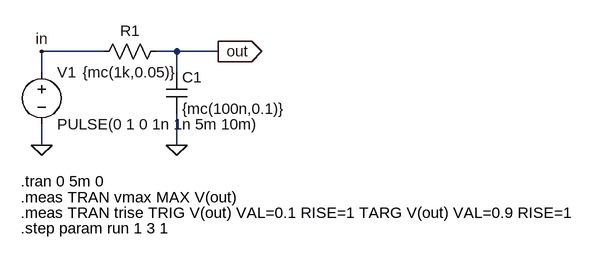
[diagram p0: schematic rc_mc.asc]
rc_mc.asc, the LTspice schematic file:
Version 4
SHEET 1 880 680
WIRE 112 96 16 96
WIRE 224 96 192 96
WIRE 288 96 224 96
WIRE 16 128 16 96
WIRE 224 128 224 96
WIRE 16 240 16 208
WIRE 224 240 224 192
FLAG 16 240 0
FLAG 224 240 0
FLAG 288 96 out
IOPIN 288 96 Out
FLAG 16 96 in
SYMBOL voltage 16 112 R0
SYMATTR InstName V1
SYMATTR Value PULSE(0 1 0 1n 1n 5m 10m)
SYMBOL res 208 80 R90
WINDOW 0 0 56 VBottom 2
WINDOW 3 32 56 VTop 2
SYMATTR InstName R1
SYMATTR Value {mc(1k,0.05)}
SYMBOL cap 208 128 R0
SYMATTR InstName C1
SYMATTR Value {mc(100n,0.1)}
TEXT -16 296 Left 2 !.tran 0 5m 0
TEXT -16 320 Left 2 !.meas TRAN vmax MAX V(out)
TEXT -16 344 Left 2 !.meas TRAN trise TRIG V(out) VAL=0.1 RISE=1 TARG V(out) VAL=0.9 RISE=1
TEXT -16 368 Left 2 !.step param run 1 3 1

The netlist it stands for:
* rc_mc.asc
V1 in 0 PULSE(0 1 0 1n 1n 5m 10m)
R1 out in {mc(1k,0.05)}
C1 out 0 {mc(100n,0.1)}
.tran 0 5m 0
.meas TRAN vmax MAX V(out)
.meas TRAN trise TRIG V(out) VAL=0.1 RISE=1 TARG V(out) VAL=0.9 RISE=1
.step param run 1 3 1
.backanno
.end